# Altium schematic sheet 000_Hierarchical.SchDoc: Hieralchical system
size A4; Date: XXXXXX; DrawnBy: Y.Gonzalez; Revision: R1V0; SheetNumber: 1; SheetTotal: 5
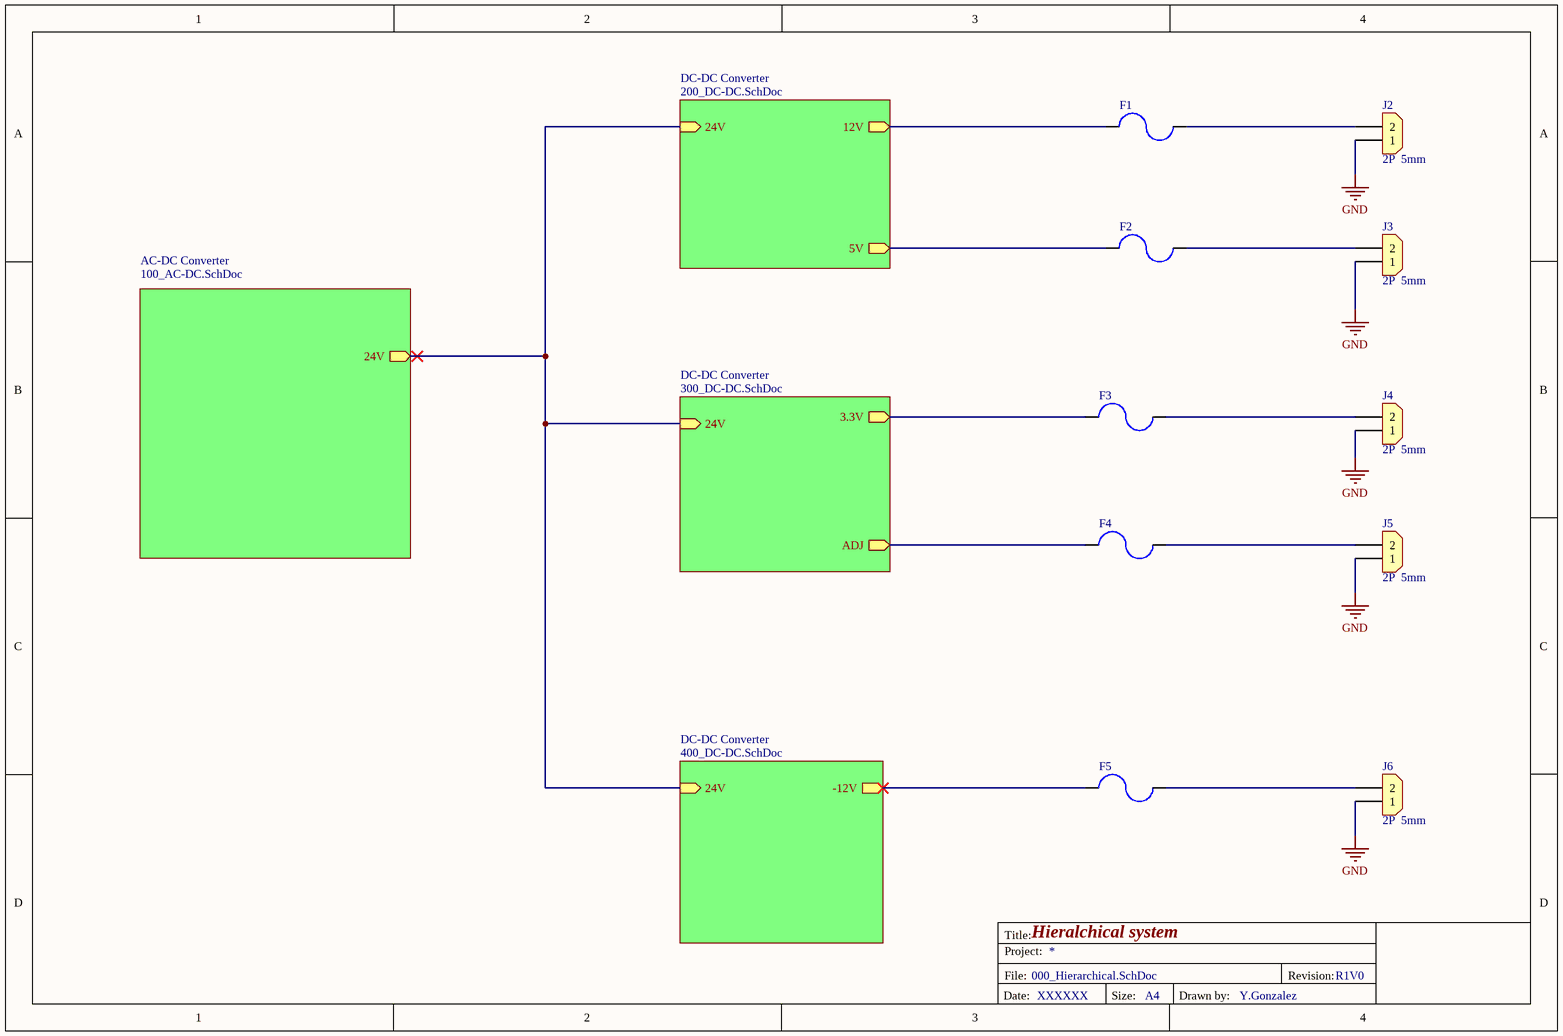
[diagram p0: 000_Hierarchical.SchDoc]

## Parts
F1  16V 5A  [FUSE_RADIAL_14.20X10.00X2.50mm]  (value not drawn)
F2  16V 5A  [FUSE_RADIAL_14.20X10.00X2.50mm]  (value not drawn)
F3  16V 4A  [FUSE_RADIAL_12.80X8.40X2.50mm]  (value not drawn)
F4  16V 4A  [FUSE_RADIAL_12.80X8.40X2.50mm]  (value not drawn)
F5  16V 1.6A  [1812]  (value not drawn)
J2  2P  5mm  [CON_2x1_TH_5mm]
J3  2P  5mm  [CON_2x1_TH_5mm]
J4  2P  5mm  [CON_2x1_TH_5mm]
J5  2P  5mm  [CON_2x1_TH_5mm]
J6  2P  5mm  [CON_2x1_TH_5mm]

## Sub-sheets
AC-DC Converter = 100_AC-DC.SchDoc: 24V (out)
DC-DC Converter = 200_DC-DC.SchDoc: 24V (in), 12V (out), 5V (out)
DC-DC Converter = 300_DC-DC.SchDoc: 24V (in), 3.3V (out), ADJ (out)
DC-DC Converter = 400_DC-DC.SchDoc: 24V (in), -12V (out)

## Nets
GND: J2.1 J3.1 J4.1 J5.1 J6.1
NetF1_1: F1.1 ; sheet DC-DC Converter/12V
NetF1_2: F1.2 J2.2
NetF2_1: F2.1 ; sheet DC-DC Converter/5V
NetF2_2: F2.2 J3.2
NetF3_1: F3.1 ; sheet DC-DC Converter/3.3V
NetF3_2: F3.2 J4.2
NetF4_1: F4.1 ; sheet DC-DC Converter/ADJ
NetF4_2: F4.2 J5.2
NetF5_1: F5.1 ; sheet DC-DC Converter/-12V
NetF5_2: F5.2 J6.2
(unnamed): sheet AC-DC Converter/24V, sheet DC-DC Converter/24V, sheet DC-DC Converter/24V, sheet DC-DC Converter/24V

## Notes on the sheet
- Title:
- Project:
- File:
- Revision:
- Date:
- Size:
- A4
- Drawn by:

## Library data of the parts
F1 F2 = F_5A_16V_PTC: PTC RESET FUSE 16V 5A RADIAL; Manufacturer: Littelfuse Inc.; Manufacturer Part Number: RGEF500; Reel Sotck: N/A; Last modified by: J.Jaramillo; Last modified date: 20240309; Supplier 1: Digi-Key; Supplier Part Number 1: RGEF500HF-ND; ComponentLink1Description: Digi-key; ComponentLink1URL: https://www.digikey.com/product-detail/en/littelfuse-inc/RGEF500/RGEF500HF-ND/5029781
F3 F4 = F_4A_16V_PTC: PTC RESET FUSE 16V 4A RADIAL; Manufacturer: Littelfuse Inc.; Manufacturer Part Number: RGEF400; Reel Sotck: N/A; Last modified by: J.Jaramillo; Last modified date: 20240309; Supplier 1: Digi-Key; Supplier Part Number 1: RGEF400HF-ND; ComponentLink1Description: Digi-key; ComponentLink1URL: https://www.digikey.com/product-detail/en/littelfuse-inc/RGEF400/RGEF400HF-ND/5130245
F5 = F_1.6A_16V_PTC: PTC RESET FUSE 16V 1.6A 1812; Manufacturer: Bel Fuse Inc.; Manufacturer Part Number: 0ZCG0160BF2C; Supplier 1: Digi-Key; Supplier Part Number 1: 507-1776-1-ND; Reel Sotck: N/A; Last modified by: J.Jaramillo; Last modified date: 20240309; ComponentLink1Description: Digi-Key; ComponentLink1URL: https://www.digikey.com/product-detail/en/bel-fuse-inc/0ZCG0160BF2C/507-1776-1-ND/4156320
J2-J6 = Con_2x1_TH_5mm: TERM BLK 2POS SIDE ENTRY 5MM PCB; Manufacturer: Phoenix Contact; Manufacturer Part Number: 1935161; Supplier Part Number 1: 277-1667-ND; Last modified by: J.Jaramillo; Last modified date: 20240310; ComponentLink1Description: Digi-key; ComponentLink1URL: https://www.digikey.com/en/products/detail/phoenix-contact/1935161/568614; Reel Stock: N/A; Supplier 1: Digi-Key